# Altium schematic sheet Control.SchDoc
size 50 x 19 mm
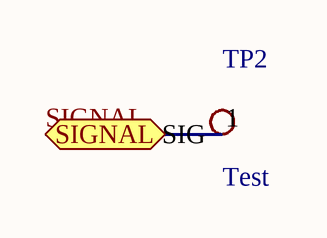
[diagram p0: Control.SchDoc]

## Parts
TP2  Test

## Ports
SIGNAL

## Nets
SIGNAL: TP2.1(SIG) ; port SIGNAL

## Library data of the parts
TP2 = Tap